# EAGLE schematic Dragon-Lamp (EAGLE 9.6.2)
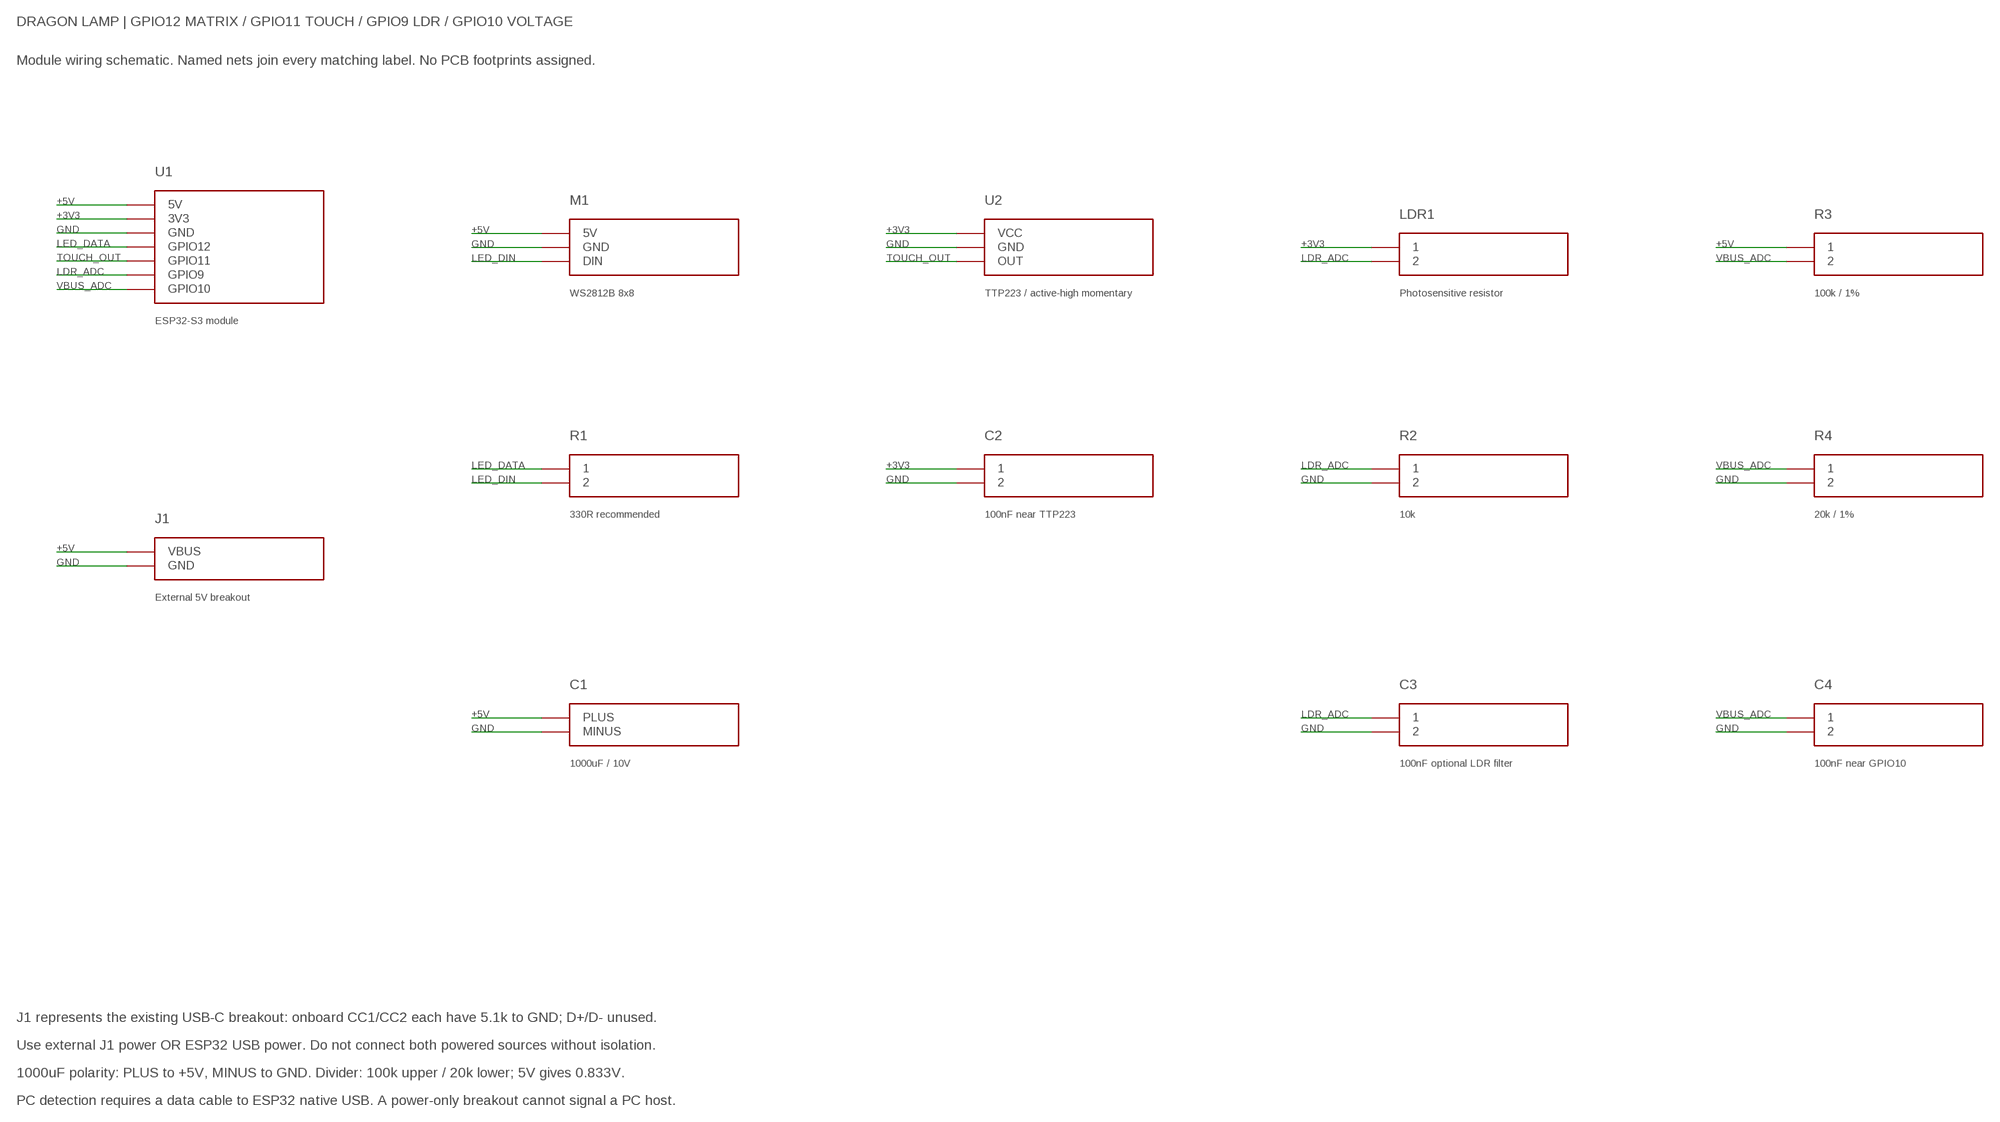
[diagram p0: schematic, sheet 1]

## Parts
C1  1000uF / 10V  ELECTROLYTIC  (no package)
C2  100nF near TTP223  CAPACITOR  (no package)
C3  100nF optional LDR filter  CAPACITOR  (no package)
C4  100nF near GPIO10  CAPACITOR  (no package)
J1  External 5V breakout  USB_C_BREAKOUT  (no package)
LDR1  Photosensitive resistor  LDR  (no package)
M1  WS2812B 8x8  MATRIX  (no package)
R1  330R recommended  RESISTOR  (no package)
R2  10k  RESISTOR  (no package)
R3  100k / 1%  RESISTOR  (no package)
R4  20k / 1%  RESISTOR  (no package)
U1  ESP32-S3 module  ESP32_S3  (no package)
U2  TTP223 / active-high momentary  TTP223  (no package)

## Nets
+3V3: C2.1 LDR1.1 U1.3V3 U2.VCC
+5V: C1.PLUS J1.VBUS M1.5V R3.1 U1.5V
GND: C1.MINUS C2.2 C3.2 C4.2 J1.GND M1.GND R2.2 R4.2 U1.GND U2.GND
LDR_ADC: C3.1 LDR1.2 R2.1 U1.GPIO9
LED_DATA: R1.1 U1.GPIO12
LED_DIN: M1.DIN R1.2
TOUCH_OUT: U1.GPIO11 U2.OUT
VBUS_ADC: C4.1 R3.2 R4.1 U1.GPIO10

## Notes on the sheet
- DRAGON LAMP | GPIO12 MATRIX / GPIO11 TOUCH / GPIO9 LDR / GPIO10 VOLTAGE
- Module wiring schematic. Named nets join every matching label. No PCB footprints assigned.
- J1 represents the existing USB-C breakout: onboard CC1/CC2 each have 5.1k to GND; D+/D- unused.
- Use external J1 power OR ESP32 USB power. Do not connect both powered sources without isolation.
- 1000uF polarity: PLUS to +5V, MINUS to GND. Divider: 100k upper / 20k lower; 5V gives 0.833V.
- PC detection requires a data cable to ESP32 native USB. A power-only breakout cannot signal a PC host.

## Library data of the parts
C1 = DragonModules:ELECTROLYTIC
C2-C4 = DragonModules:CAPACITOR
J1 = DragonModules:USB_C_BREAKOUT
LDR1 = DragonModules:LDR
M1 = DragonModules:MATRIX
R1-R4 = DragonModules:RESISTOR
U1 = DragonModules:ESP32_S3
U2 = DragonModules:TTP223

## Net classes
0 default: clearance 0.254 mm